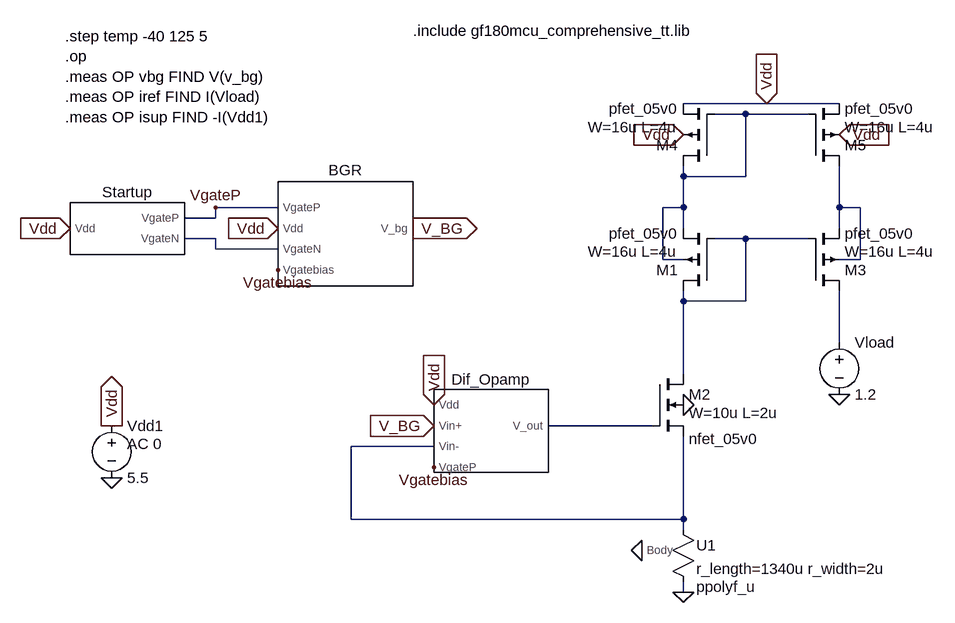
[diagram p0: schematic Final.asc]
Final.asc, the LTspice schematic file:
Version 4.1
SHEET 1 880 1300
WIRE -1152 -96 -1280 -96
WIRE -1040 -96 -1152 -96
WIRE -1184 -80 -1232 -80
WIRE -1088 -80 -1184 -80
WIRE -1280 16 -1280 0
WIRE -1184 16 -1184 -80
WIRE -1184 16 -1280 16
WIRE -1904 64 -2000 64
WIRE -1280 64 -1280 16
WIRE -1280 64 -1312 64
WIRE -1040 64 -1040 0
WIRE -1008 64 -1040 64
WIRE -2000 80 -2000 64
WIRE -2000 80 -2048 80
WIRE -1280 96 -1280 64
WIRE -1040 96 -1040 64
WIRE -2000 112 -2048 112
WIRE -1184 112 -1232 112
WIRE -1088 112 -1184 112
WIRE -2000 128 -2000 112
WIRE -1904 128 -2000 128
WIRE -1312 144 -1312 64
WIRE -1280 144 -1312 144
WIRE -1008 144 -1008 64
WIRE -1008 144 -1040 144
WIRE -1280 208 -1280 192
WIRE -1184 208 -1184 112
WIRE -1184 208 -1280 208
WIRE -1040 272 -1040 192
WIRE -1280 320 -1280 208
WIRE -1328 400 -1488 400
WIRE -1664 432 -1792 432
WIRE -1792 544 -1792 432
WIRE -1280 544 -1280 416
WIRE -1280 544 -1792 544
WIRE -1280 560 -1280 544
WIRE -1280 656 -1280 640
FLAG -2224 96 Vdd
IOPIN -2224 96 In
FLAG -2160 480 0
FLAG -2160 400 Vdd
IOPIN -2160 400 Out
FLAG -1904 96 Vdd
IOPIN -1904 96 In
FLAG -1696 96 V_BG
IOPIN -1696 96 Out
FLAG -2000 64 VgateP
FLAG -1664 368 Vdd
IOPIN -1664 368 In
FLAG -1280 368 0
FLAG -1664 400 V_BG
IOPIN -1664 400 In
FLAG -1280 656 0
FLAG -1040 352 0
FLAG -1344 592 0
FLAG -1040 -48 Vdd
IOPIN -1040 -48 In
FLAG -1280 -48 Vdd
IOPIN -1280 -48 In
FLAG -1152 -96 Vdd
IOPIN -1152 -96 In
FLAG -1904 160 Vgatebias
FLAG -1664 464 Vgatebias
SYMBOL voltage -2160 384 R0
WINDOW 123 24 44 Left 2
WINDOW 39 0 0 Left 0
SYMATTR Value2 AC 0
SYMATTR InstName Vdd1
SYMATTR Value 5.5
SYMBOL BGR -1824 64 R0
SYMATTR InstName BGR
SYMBOL Startup -2144 96 R0
SYMATTR InstName Startup
SYMBOL Dif_opamp -1584 400 R0
SYMATTR InstName Dif_Opamp
SYMBOL nmos4 -1328 320 R0
WINDOW 3 56 60 Left 2
WINDOW 38 56 100 Left 2
SYMATTR Value W=10u L=2u
SYMATTR SpiceModel nfet_05v0
SYMATTR InstName M2
SYMATTR Prefix X
SYMBOL pmos4 -1232 192 R180
WINDOW 3 56 60 Left 2
WINDOW 38 56 88 Left 2
SYMATTR Value W=16u L=4u
SYMATTR SpiceModel pfet_05v0
SYMATTR InstName M1
SYMATTR Prefix X
SYMBOL pmos4 -1088 192 M180
WINDOW 3 56 60 Left 2
WINDOW 38 56 88 Left 2
SYMATTR Value W=16u L=4u
SYMATTR SpiceModel pfet_05v0
SYMATTR InstName M3
SYMATTR Prefix X
SYMBOL res3 -1296 544 R0
WINDOW 38 36 104 Left 2
SYMATTR SpiceModel ppolyf_u
SYMATTR InstName U1
SYMATTR Value r_length=1340u r_width=2u
SYMBOL voltage -1040 256 R0
WINDOW 123 0 0 Left 0
SYMATTR InstName Vload
SYMATTR Value 1.2
SYMBOL pmos4 -1232 0 R180
WINDOW 3 56 60 Left 2
WINDOW 38 56 88 Left 2
SYMATTR Value W=16u L=4u
SYMATTR SpiceModel pfet_05v0
SYMATTR InstName M4
SYMATTR Prefix X
SYMBOL pmos4 -1088 0 M180
WINDOW 3 56 60 Left 2
WINDOW 38 56 88 Left 2
SYMATTR Value W=16u L=4u
SYMATTR SpiceModel pfet_05v0
SYMATTR InstName M5
SYMATTR Prefix X
TEXT -1696 -208 Left 2 !.include gf180mcu_comprehensive_tt.lib
TEXT -2232 -200 Left 2 !.step temp -40 125 5\n.op\n.meas OP vbg FIND V(v_bg)\n.meas OP iref FIND I(Vload)\n.meas OP isup FIND -I(Vdd1)

The netlist it stands for:
* Final.asc
Vdd1 Vdd 0 5.5 AC 0
X§BGR Vdd V_BG VgateP N003 Vgatebias BGR  ; pins Vdd V_bg VgateP VgateN Vgatebias
X§Startup Vdd N003 VgateP Startup  ; pins Vdd VgateN VgateP
X§Dif_Opamp Vdd V_BG N007 N006 Vgatebias Dif_opamp  ; pins Vdd Vin+ Vin- V_out VgateP
X§M2 N004 N006 N007 0 nfet_05v0 W=10u L=2u  ; pins D G S B
X§M1 N004 N004 N001 N001 pfet_05v0 W=16u L=4u  ; pins D G S B
X§M3 N005 N004 N002 N002 pfet_05v0 W=16u L=4u  ; pins D G S B
X§U1 N007 0 0 ppolyf_u r_length=1340u r_width=2u  ; pins A B Body
Vload N005 0 1.2
X§M4 N001 N001 Vdd Vdd pfet_05v0 W=16u L=4u  ; pins D G S B
X§M5 N002 N001 Vdd Vdd pfet_05v0 W=16u L=4u  ; pins D G S B
.include gf180mcu_comprehensive_tt.lib
.step temp -40 125 5
.op
.meas OP vbg FIND V(v_bg)
.meas OP iref FIND I(Vload)
.meas OP isup FIND -I(Vdd1)
.backanno
.end

* Results of the author's LTspice run, read from the files saved beside the schematic
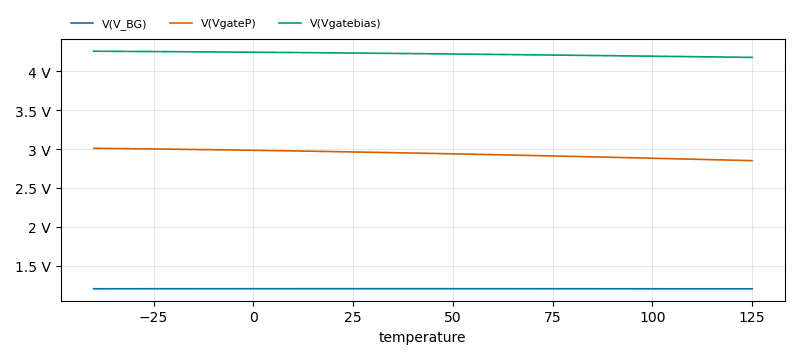
[diagram p1: Operating Point of Final.asc, plotted from the saved traces]
* Operating Point, 1 run:
*   V(V_BG): 1.207 V at temperature=-40 , 1.206 V at temperature=125 , min 1.206 V, max 1.208 V
*   V(VgateP): 3.009 V at temperature=-40 , 2.851 V at temperature=125 , min 2.851 V, max 3.009 V
*   V(Vgatebias): 4.254 V at temperature=-40 , 4.175 V at temperature=125 , min 4.175 V, max 4.254 V
* From the log:
*   vbg: V(v_bg)=1.20710110664 at -40
*   iref: I(Vload)=4.97137079947e-06 at -40
*   isup: -I(Vdd1)=2.37294370891e-05 at -40